# Altium project Powermodule-v11.0.0.PrjPcb (part 1 of 5)
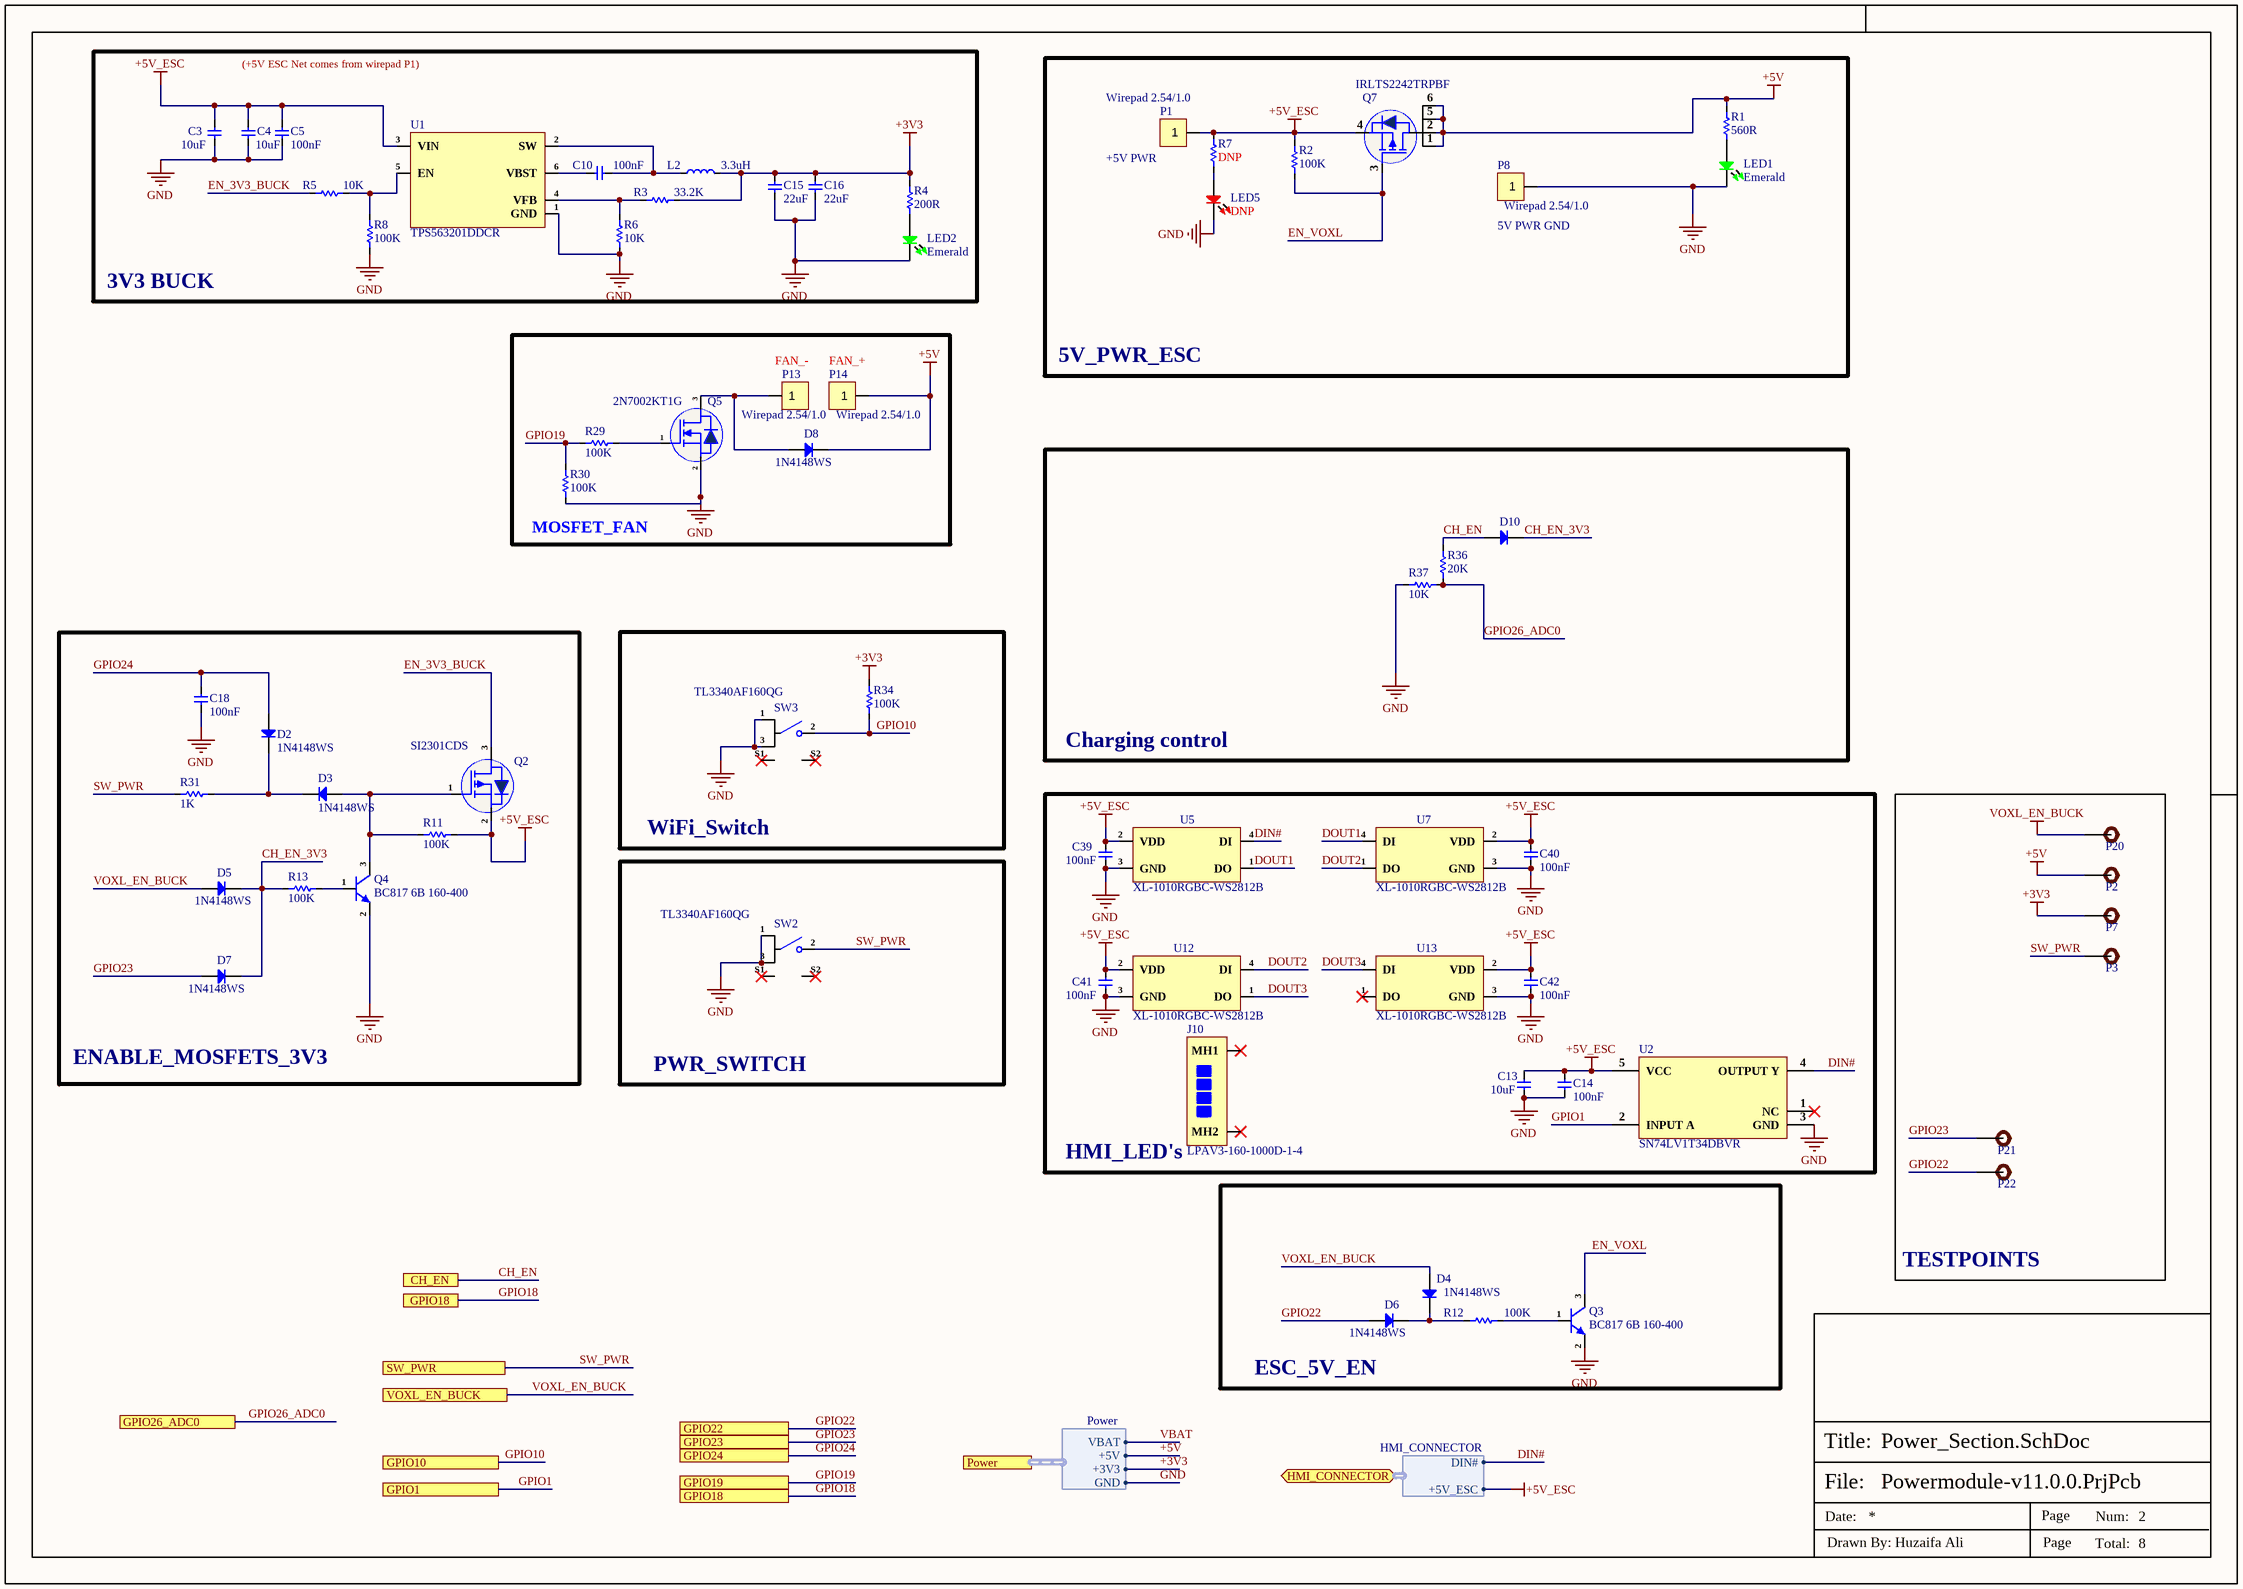
[diagram p0: Power_Section.SchDoc]
7 sheets, 227 parts. Net scope: flat (ports and power ports of the same name join across sheets).
Board file: PCB-Powermodule-v11.0.0.PcbDoc
Sheets:
  Power_Section.SchDoc
  Controller_Section.SchDoc
  FlashMemory_Section.SchDoc
  WiFiModule_Section.SchDoc
  Connector_Section.SchDoc
  USB HUB_Section.SchDoc
  RTC_Section.SchDoc

## Sheet Power_Section.SchDoc
size 420 x 297 mm; SheetNumber: 2; SheetTotal: 8

### Parts
C3  10uF  [Cap-0603]
C4  10uF  [Cap-0603]
C5  100nF  [cap-0402]
C10  100nF  [cap-0402]
C13  10uF  [Cap-0603]
C14  100nF  [cap-0402]
C15  22uF  [Cap-0402]
C16  22uF  [Cap-0402]
C18  100nF  [cap-0402]
C39  100nF  [cap-0402]
C40  100nF  [cap-0402]
C41  100nF  [cap-0402]
C42  100nF  [cap-0402]
D2  1N4148WS  [SOD-323]
D3  1N4148WS  [SOD-323]
D4  1N4148WS  [SOD-323]
D5  1N4148WS  [SOD-323]
D6  1N4148WS  [SOD-323]
D7  1N4148WS  [SOD-323]
D8  1N4148WS  [SOD-323]
D10  1N4148WS  [SOD-323]  (value not drawn)
J10  LPAV3-160-1000D-1-4  [LPAV3-160-1000D-1-4]
L2  3.3uH  [VLS3012HBX-3R3M]
LED1  Emerald  [LED-0603]
LED2  Emerald  [LED-0603]
LED5  DNP  [LED-0603]
P1  Wirepad 2.54/1.0  [Wirepad 2.54/1.0]  (no BOM)
P2  TEST POINT  [Test-point]  (value not drawn)
P3  TEST POINT  [Test-point]  (value not drawn)
P7  TEST POINT  [Test-point]  (value not drawn)
P8  Wirepad 2.54/1.0  [Wirepad 2.54/1.0]  (no BOM)
P13  Wirepad 2.54/1.0  [Wirepad 2.54/1.0]  (no BOM)
P14  Wirepad 2.54/1.0  [Wirepad 2.54/1.0]  (no BOM)
P20  TEST POINT  [Test-point]  (value not drawn)
P21  TEST POINT  [Test-point]  (value not drawn)
P22  TEST POINT  [Test-point]  (value not drawn)
Q2  SI2301CDS  [SOT-23]
Q3  BC817 6B 160-400  [SOT-23]
Q4  BC817 6B 160-400  [SOT-23]
Q5  2N7002KT1G  [SOT-23]
Q7  IRLTS2242TRPBF  [6-TSOP_]
R1  560R  [Res-0402]
R2  100K  [Res-0402]
R3  33.2K  [Res-0603]
R4  200R  [Res-0402]
R5  10K  [Res-0402]
R6  10K  [Res-0402]
R7  DNP  [Res-0402]
R8  100K  [Res-0402]
R11  100K  [Res-0402]
R12  100K  [Res-0402]
R13  100K  [Res-0402]
R29  100K  [Res-0402]
R30  100K  [Res-0402]
R31  1K  [Res-0402]
R34  100K  [Res-0402]
R36  20K  [Res-0603]
R37  10K  [Res-0402]
SW2  TL3340AF160QG  [TL3340AF160QG]
SW3  TL3340AF160QG  [TL3340AF160QG]
U1  TPS563201DDCR  [SOT-23-6 THIN]
U2  SN74LV1T34DBVR  [SOT-23-5]
U5  XL-1010RGBC-WS2812B  [XL-1010RGBC-WS2812B]
U7  XL-1010RGBC-WS2812B  [XL-1010RGBC-WS2812B]
U12  XL-1010RGBC-WS2812B  [XL-1010RGBC-WS2812B]
U13  XL-1010RGBC-WS2812B  [XL-1010RGBC-WS2812B]

### Blocks framed on the sheet
3V3 BUCK: C3-C5 C10 C15 C16 L2 LED2 R3-R6 R8 U1
5V_PWR_ESC: LED1 LED5 P1 P8 Q7 R1 R2 R7
MOSFET_FAN: D8 P13 P14 Q5 R29 R30
Charging control: D10 R36 R37
ENABLE_MOSFETS_3V3: C18 D2 D3 D5 D7 Q2 Q4 R11 R13 R31
WiFi_Switch: R34 SW3
HMI_LED's: C13 C14 C39-C42 J10 U2 U5 U7 U12 U13
TESTPOINTS: P2 P3 P7 P20-P22
PWR_SWITCH: SW2
ESC_5V_EN: D4 D6 Q3 R12

### Ports
CH_EN (see Top-Sheet[2C], Connector_Section[4D]), GPIO1 (see Top-Sheet[2C], Controller_Section[1D]), GPIO10 (see Top-Sheet[2C], Controller_Section[1D]), GPIO18 (see Top-Sheet[2C], Connector_Section[4D], Controller_Section[1D]), GPIO19 (see Top-Sheet[2C], Controller_Section[1D]), GPIO22 (see Top-Sheet[2B], Controller_Section[1D]), GPIO23 (see Top-Sheet[2B], Controller_Section[1D]), GPIO24 (see Top-Sheet[2B], Controller_Section[1D]), GPIO26_ADC0 (see Top-Sheet[2C], Controller_Section[1D]), HMI_CONNECTOR (bidir, harness HMI_CONNECTOR, see Top-Sheet[1B], Connector_Section[4D]), Power (harness Power, see Top-Sheet[1B], Connector_Section[4D], Controller_Section[2D], FlashMemory_Section[1D], RTC_Section[2D], USB HUB_Section[1D], WiFiModule_Section[2D]), SW_PWR (see Top-Sheet[1C], Connector_Section[1D]), VOXL_EN_BUCK (see Top-Sheet[1B], Connector_Section[2D])

### Harnesses
Power: +5V, +3V3, GND, VBAT
HMI_CONNECTOR: DIN#, +5V_ESC

### Nets
+3V3: C15.2 C16.2 L2.2 P7.1 R3.2 R4.2 R34.1 ; port Power.+3V3
+5V: D8.1(K) P2.1 P14.1 Q7.1(D) Q7.2(D) Q7.5(D) Q7.6(D) R1.2 ; port Power.+5V
+5V_ESC: C3.2 C4.2 C5.2 C13.2 C14.2 C39.1 C40.1 C41.1 C42.1 P1.1 Q2.2(S) Q7.4(S) R2.2 R7.2 R11.1 U1.3(VIN) U2.5(VCC) U5.2(VDD) U7.2(VDD) U12.2(VDD) U13.2(VDD) ; port HMI_CONNECTOR.+5V_ESC
GND: C3.1 C4.1 C5.1 C13.1 C14.1 C15.1 C16.1 C18.2 C39.2 C40.2 C41.2 C42.2 LED1.2 LED2.2 LED5.2 P8.1 Q3.2(E) Q4.2(E) Q5.2(S) R6.1 R8.1 R30.1 R37.1 SW2.1(COM_1) SW2.3(COM_2) SW3.1(COM_1) SW3.3(COM_2) U1.1(GND) U2.3(GND) U5.3(GND) U7.3(GND) U12.3(GND) U13.3(GND) ; port Power.GND
VOXL_EN_BUCK: D4.2(A) D5.2(A) P20.1 ; port VOXL_EN_BUCK
CH_EN: D10.2(A) R36.2 ; port CH_EN
CH_EN_3V3: D5.1(K) D7.1(K) D10.1(K) R13.2
DIN#: U2.4(OUTPUT_Y) U5.4(DI) ; port HMI_CONNECTOR.DIN#
DOUT1: U5.1(DO) U7.4(DI)
DOUT2: U7.1(DO) U12.4(DI)
DOUT3: U12.1(DO) U13.4(DI)
EN_3V3_BUCK: Q2.3(D) R5.1
EN_VOXL: Q3.3(C) Q7.3(G) R2.1
GPIO1: U2.2(INPUT_A) ; port GPIO1
GPIO10: R34.2 SW3.2(NO) ; port GPIO10
GPIO19: R29.2 R30.2 ; port GPIO19
GPIO22: D6.2(A) P22.1 ; port GPIO22
GPIO23: D7.2(A) P21.1 ; port GPIO23
GPIO24: C18.1 D2.2(A) ; port GPIO24
GPIO26_ADC0: R36.1 R37.2 ; port GPIO26_ADC0
SW_PWR: P3.1 R31.1 SW2.2(NO) ; port SW_PWR
VBAT: port Power.VBAT
NetC10_1: C10.1 L2.1 U1.2(SW)
NetC10_2: C10.2 U1.6(VBST)
NetD2_1: D2.1(K) D3.1(K) R31.2
NetD3_2: D3.2(A) Q2.1(G) Q4.3(C) R11.2
NetD4_1: D4.1(K) D6.1(K) R12.1
NetD8_2: D8.2(A) P13.1 Q5.3(D)
NetLED1_1: LED1.1 R1.1
NetLED2_1: LED2.1 R4.1
NetLED5_1: LED5.1 R7.1
NetQ3_1: Q3.1(B) R12.2
NetQ4_1: Q4.1(B) R13.1
NetQ5_1: Q5.1(G) R29.1
NetR3_1: R3.1 R6.2 U1.4(VFB)
NetR5_2: R5.2 R8.2 U1.5(EN)

Not connected (* = marked no-connect by the designer): J10 MH1* MH2*; SW2 S1(GND)* S2(GND)*; SW3 S1(GND)* S2(GND)*; U2 1(NC)*; U13 1(DO)*

### Notes on the sheet
- (+5V ESC Net comes from wirepad P1)
- +5V PWR
- (near P8) 5V PWR GND
- (near P13) FAN_-
- (near P14) FAN_+
- File:
- Title:
- Date:
- Page
- Num:
- Total:
- Drawn By: Huzaifa Ali

### Library data of the parts
C3 C4 C13 = GRM188R61E106KA73D: CAP CER 10UF 25V X5R 0603; Manufacturer: Murata; Supplier 1: Mouser; Manufacturer Part Number: GRM188R61E106KA73D; RoHS: Yes; Category: Ceramic Capacitors; Stock 1: 319428; Pricing 1: 1=0.36000, 10=0.25800, 50=0.25800, 100=0.15500, 1000=0.09800, 10000=0.06900 (USD); Case/Package: 0603; RoHS Compliant: Yes; ComponentLink1URL: https://search.murata.co.jp/Ceramy/image/img/A01X/G101/ENG/GRM188R61E106KA73-01.pdf?src-supplier=Digi-Key; ComponentLink1Description: https://search.murata.co.jp/Ceramy/image/img/A01X/G101/ENG/GRM188R61E106KA73-01.pdf?src-supplier=Digi-Key; Supplier Part Number 1: 81-GRM188R61E106KA3D; LCSC Part Number: C344022
C5 C10 C14 C18 C39-C42 = C1005X7R1H104KT000F: CAP CER 0.1UF 50V X7R 0402; Manufacturer: TDK; Tolerance: 10%; Voltage: 25V; Item Type: Capacitor; Supplier 1: Avnet; Manufacturer Part Number: C1005X7R1H104KT000F; RoHS: No; Category: Ceramic Capacitors; Dielectric: X7R; Supplier Part Number 1: C1005X7R1H104KT000F; LCSC Part Number: C361198; ComponentLink1Description: LCSC; ComponentLink1URL: https://www.lcsc.com/product-detail/Multilayer-Ceramic-Capacitors-MLCC-SMD-SMT_TDK-C1005X7R1H104KT000F_C361198.html
C15 C16 = GRM158R61A226ME15D: CAP CER 22UF 10V X5R 0402; Manufacturer: Murata; Material: 4241ConductorMaterial; Dielectric: 1537DielectricType; Tolerance: 20%; Item Type: Capacitor; Supplier: Mouser; Supplier Part Number: 81-GRM158R61A226ME5D; Manufacturer Part Number: GRM158R61A226ME15D; RoHS: Yes; Stock: 328944; Pricing: 1=0.46, 10=0.225, 50=0.225, 100=0.146, 1000=0.124, 10000=0.106 (USD); Case/Package: 343Case; Min Operating Temperature: -55°C; Max Operating Temperature: 85°C; Value: 22uF; Voltage Rating: 10V; Voltage Rating (DC): 10V; Length: 1mm; Width: 500um; Height: 800um; Thickness: 800um; LCSC Part Number: C3845593; Category: Ceramic Capacitors
D2-D8 D10 = 1N4148WS: 75V 200mW Single 1.25V@150mA 4ns 150mA SOD-323 Switching Diode ROHS; Manufacturer: Guangdong Hottech; Manufacturer Part Number: 1N4148WS; Package: SOD-323; LCSC Part Number: C181133; Item Type: Diode
J10 = LPAV3-160-1000D-1-4: LED INDICATION, ROUND, CLEAR, DO; Manufacturer: Bivar; Item Type: Light Pipe; Lens Style: Round,Domed; Lens Size: 3mm; Supplier: Digikey; Supplier Part Number: 492-LPAV3-160-1000D-1-4-ND; Manufacturer Part Number: LPAV3-160-1000D-1-4; RoHS: No; Pricing: 1=3.89, 10=2.865, 100=2.2565, 500=1.98982, 1000=1.90308, 2000=1.82968, 5000=1.74974 (USD); Mounting Technology: Press-Fit,Board; Series: -; ComponentLink1URL: https://cdn2.hubspot.net/hubfs/5642389/LPAV3-160-1000D-1-4_A.pdf?src-supplier=Digikey; ComponentLink1Description: https://cdn2.hubspot.net/hubfs/5642389/LPAV3-160-1000D-1-4_A.pdf?src-supplier=Digikey
L2 = VLS3012HBX-3R3M: FIXED IND 3.3UH 2.63A 150MOHM SM; Manufacturer: TDK; Core Material: Metal; Tolerance: 20%; Saturation Current: 2.82A; Shielding: Shielded; DC Resistance (DCR): 150mR; Test Frequency: 1MHz; Supplier: Digi-Key; Supplier Part Number: 445-175070-1-ND; Manufacturer Part Number: VLS3012HBX-3R3M; RoHS: Yes; Category: Fixed Inductors; Stock: 9595; Pricing: 1=0.6, 10=0.512, 25=0.4692, 50=0.4264, 100=0.3795, 250=0.3582, 500=0.30702, 1000=0.27291 (USD); Mounting Technology: Surface Mount; Case/Package: Nonstandard; Min Operating Temperature: -40°C; Max Operating Temperature: 105°C; Packaging: Cut Tape; Value: 3.3uH; Current Rating: 2.63A; Series: VLS-HBX; RoHS Compliant: Yes; ComponentLink1URL: http://www.farnell.com/datasheets/2724074.pdf?src-supplier=Farnell; ComponentLink1Description: http://www.farnell.com/datasheets/2724074.pdf?src-supplier=Farnell; ComponentLink2URL: https://product.tdk.com/info/en/catalog/datasheets/inductor_commercial_power_vls3012hbx_en.pdf?src-supplier=Digi-Key; ComponentLink2Description: https://product.tdk.com/info/en/catalog/datasheets/inductor_commercial_power_vls3012hbx_en.pdf?src-supplier=Digi-Key; ComponentLink3URL: https://product.tdk.com/info/en/catalog/datasheets/inductor_commercial_power_vls3012hbx_en.pdf?ref_disty=digikey&src-supplier=Digi-Key; ComponentLink3Description: https://product.tdk.com/info/en/catalog/datasheets/inductor_commercial_power_vls3012hbx_en.pdf?ref_disty=digikey&src-supplier=Digi-Key; ComponentLink4URL: http://www.farnell.com/datasheets/2724074.pdf?src-supplier=Newark; ComponentLink4Description: http://www.farnell.com/datasheets/2724074.pdf?src-supplier=Newark
LED1 LED2 = NCD0603G2: Emerald 0603 Light Emitting Diodes (LED) ROHS; Manufacturer: Foshan NationStar Optoelectronics; Manufacturer Part Number: NCD0603G2; Package: 0603; LCSC Part Number: C87326; Item Type: LED; ComponentLink1Description: LCSC; ComponentLink1URL: https://www.lcsc.com/product-detail/Light-Emitting-Diodes-LED_Foshan-NationStar-Optoelectronics-NCD0603G2_C87326.html
LED5 = NCD0603R3: RED LED 0603 Light Emitting Diodes; Manufacturer: Foshan NationStar Optoelectronics; Manufacturer Part Number: NCD0603R3; Package: 0603; Item Type: LED; LCSC Part Number: C3151730; ComponentLink1Description: LCSC; ComponentLink1URL: https://www.lcsc.com/product-detail/Light-Emitting-Diodes-LED_Foshan-NationStar-Optoelectronics-NCD0603R3_C3151730.html
P2 P3 P7 P20-P22 = TEST POINT: Test Point ON; Item Type: TEST POINT; Manufacturer Part Number: TEST POINT
Q2 = SI2301CDS: null 3A 400mW 112mΩ@4.5V,2.8A 1V@250uA P Channel SOT-23 MOSFETs ROHS; Manufacturer: FUXINSEMI; Manufacturer Part Number: SI2301CDS; LCSC Part Number: C5290223; Item Type: SOT-23; ComponentLink1Description: LCSC; ComponentLink1URL: https://www.lcsc.com/product-detail/MOSFETs_FUXINSEMI-SI2301CDS_C5290223.html; Package: MOSFET
Q3 Q4 = BC817 6B 160-400: 45V 300mW 100@100mA,1V 500mA NPN SOT-23 Bipolar Transistors - BJT ROHS; Manufacturer: DOWO; Manufacturer Part Number: BC817 6B 160-400; Package: SOT-23; LCSC Part Number: C371086; Item Type: Transistor; ComponentLink1Description: LCSC; ComponentLink1URL: https://www.lcsc.com/product-detail/Bipolar-Transistors-BJT_DOWO-BC817-6B-160-400_C371086.html
Q5 = 2N7002KT1G: MOSFET N-CH 60V 320MA SOT23-3; Manufacturer: ON Semiconductor; Input Capacitance: 24.5pF; Max Power Dissipation: 420mW; Rds On Max: 1.6R; Rise Time: 9ns; Nominal Vgs: 2.3V; Number of Elements: 1; Power Dissipation: 300mW; Turn-Off Delay Time: 55.8ns; Turn-On Delay Time: 12.2ns; Element Configuration: Single; Gate to Source Voltage (Vgs): 20V; Polarity: N-CHANNEL; Number of Channels: 1NUMBER; Supplier: Future Electronics; Supplier Part Number: 3445699; Manufacturer Part Number: 2N7002KT1G; RoHS: Yes; Category: MOSFETs; Stock: 51000; Pricing: 3000=0.0238, 12000=0.0228, 45000=0.0218, 75000=0.0215, 150000=0.0204 (USD); Case/Package: SOT-23-3; Pins: 3; Contact Plating: Tin,Matte; Min Operating Temperature: -55°C; Max Operating Temperature: 150°C; Packaging: Tape and Reel; Continuous Drain Current (ID): 320mA; Package Quantity: 1; Drain to Source Breakdown Voltage: 60V; Fall Time: 9ns; Drain to Source Resistance: 1.6R; Threshold Voltage: 2.3V; Series: -; Drain-source On Resistance-Max: 1.6R; Length: 3.04mm; Width: 1.4mm; Height: 1.01mm; Radiation Hardening: No; Reach SVHC Compliant: No; Lead Free: Lead Free; Halogen Free: Halogen Free; RoHS Compliant: Yes; ComponentLink1URL: https://datasheet.ciiva.com/1254/2n7002k-d-1254499.pdf?src-supplier=Newark; ComponentLink1Description: https://datasheet.ciiva.com/1254/2n7002k-d-1254499.pdf?src-supplier=Newark; ComponentLink2URL: https://datasheet.ciiva.com/16220/2n7002k-d-16220919.pdf?src-supplier=Future+Electronics; ComponentLink2Description: https://datasheet.ciiva.com/16220/2n7002k-d-16220919.pdf?src-supplier=Future+Electronics; ComponentLink3URL: https://datasheet.ciiva.com/936/2n7002k-d-936793.pdf?src-supplier=Digikey; ComponentLink3Description: https://datasheet.ciiva.com/936/2n7002k-d-936793.pdf?src-supplier=Digikey; LCSC Part Number: C116584; Item Type: MOSFET
Q7 = IRLTS2242TRPBF: MOSFET P-CH 20V 6.9A 6TSOP; Manufacturer: Infineon; Item Type: MOSFETs; Turn-Off Delay Time: 18ns; Turn-On Delay Time: 5.8ns; Drain to Source Breakdown Voltage: -20V; Drain to Source Resistance: 26mR; Element Configuration: 5460ElementConfiguration; Fall Time: 68ns; Number of Channels: 1NUMBER; On-State Resistance: -32mR; Power Dissipation: 2W; Value: 55MR; Supplier: Mouser; LCSC Part Number: C538190; Manufacturer Part Number: IRLTS2242TRPBF; RoHS: Yes; Stock: 67736; Pricing: 1=0.44, 10=0.372, 50=0.372, 100=0.259, 1000=0.164, 10000=0.129 (USD); Number of Elements: 1NUMBER; Package Quantity: 3000NUMBER; Length: 3mm; Width: 1.75mm; Height: 1.3mm; Radiation Hardening: 5898YesNo; ComponentLink1URL: http://www.farnell.com/datasheets/1911990.pdf?src-supplier=Farnell; ComponentLink1Description: http://www.farnell.com/datasheets/1911990.pdf?src-supplier=Farnell; ComponentLink2URL: http://www.farnell.com/datasheets/1911990.pdf?src-supplier=Element14; ComponentLink2Description: http://www.farnell.com/datasheets/1911990.pdf?src-supplier=Element14; ComponentLink3URL: https://datasheet.octopart.com/IRLTS2242TRPBF-Infineon-datasheet-41193307.pdf?src-supplier=Newark; ComponentLink3Description: https://datasheet.octopart.com/IRLTS2242TRPBF-Infineon-datasheet-41193307.pdf?src-supplier=Newark; ComponentLink4URL: https://www.infineon.com/dgdl/irlts2242pbf.pdf?fileId=5546d462533600a401535671e9a12718&src-supplier=Digikey; ComponentLink4Description: https://www.infineon.com/dgdl/irlts2242pbf.pdf?fileId=5546d462533600a401535671e9a12718&src-supplier=Digikey; ComponentLink5URL: https://datasheet.octopart.com/IRLTS2242TRPBF-Infineon-datasheet-11534477.pdf?src-supplier=Farnell; ComponentLink5Description: https://datasheet.octopart.com/IRLTS2242TRPBF-Infineon-datasheet-11534477.pdf?src-supplier=Farnell
R1 = RC0402FR-07560RL: RES 560 OHM 1% 1/16W 0402; Manufacturer: Yageo; Power Rating: 63mW; Temperature Coefficient: 100ppm/°C; Voltage Rating: 50V; Item Type: Resistor; Supplier: Future Electronics; Supplier Part Number: 8872046; Manufacturer Part Number: RC0402FR-07560RL; RoHS: Yes; Category: Chip SMD Resistors; Stock: 1360000; Pricing: 10000=0.0012, 100000=0.0011, 300000=0.0011, 1250000=0.001, 3000000=0.0009 (USD); Case/Package: 0402; Case Code (Metric): 1005; Case Code (Imperial): 0402; Min Operating Temperature: -55°C; Max Operating Temperature: 155°C; Tolerance: 1%; Packaging: Tape and Reel; Value: 560R; Package Quantity: 1; Resistor Type: Thick Film; Number of Terminations: 2; Termination: SMD/SMT; Max Power Dissipation: 63mW; Features: Moisture Resistant; Series: RC; Construction: Rectangular; Resistance Tolerance: 1%; Length: 1mm; Width: 0.02inch; Height: 0.016inch; Depth: 0.5mm; RoHS Compliant: Yes; Military Standard: Not; Lead Free: Lead Free; Reach SVHC Compliant: Unknown; ComponentLink1URL: https://datasheet.ciiva.com/2453/pyu-r-int-thick-7-2453458.pdf?src-supplier=Digikey; ComponentLink1Description: https://datasheet.ciiva.com/2453/pyu-r-int-thick-7-2453458.pdf?src-supplier=Digikey; ComponentLink2URL: https://datasheet.ciiva.com/2453/pyu-r-int-thick-7-2453459.pdf?src-supplier=Digikey; ComponentLink2Description: https://datasheet.ciiva.com/2453/pyu-r-int-thick-7-2453459.pdf?src-supplier=Digikey; ComponentLink3URL: https://datasheet.ciiva.com/2453/pyu-r-int-thick-7-2453457.pdf?src-supplier=Digikey; ComponentLink3Description: https://datasheet.ciiva.com/2453/pyu-r-int-thick-7-2453457.pdf?src-supplier=Digikey; ComponentLink4URL: https://datasheet.ciiva.com/12558/pyu-rc0402-51-rohs-l-6-r-8721-12558383.pdf?src-supplier=Mouser; ComponentLink4Description: https://datasheet.ciiva.com/12558/pyu-rc0402-51-rohs-l-6-r-8721-12558383.pdf?src-supplier=Mouser; ComponentLink5URL: https://datasheet.ciiva.com/7850/1018594-7850042.pdf?src-supplier=Element14; ComponentLink5Description: https://datasheet.ciiva.com/7850/1018594-7850042.pdf?src-supplier=Element14; ComponentLink6URL: https://datasheet.ciiva.com/7850/1018594-7850043.pdf?src-supplier=Element14; ComponentLink6Description: https://datasheet.ciiva.com/7850/1018594-7850043.pdf?src-supplier=Element14; LCSC Part Number: C163460
R2 R8 R11-R13 R29 R30 R34 = RC0402FR-07100KL: RES 100K OHM 1% 1/16W 0402; Manufacturer: Yageo; Resistance: 100kR; Temperature Coefficient: 100ppm/°C; Power Rating: 63mW; Voltage Rating: 50V; Item Type: Resistor; Supplier 1: Mouser; Manufacturer Part Number: RC0402FR-07100KL; RoHS: Yes; Category: Chip SMD Resistors; Stock 1: 7759549; Pricing 1: 1=0.10000, 10=0.01200, 50=0.01200, 100=0.00500, 1000=0.00300, 2500=0.00200, 10000=0.00100 (USD); Case/Package: 0402; Case Code (Metric): 1005; Case Code (Imperial): 0402; Min Operating Temperature: -55°C; Max Operating Temperature: 155°C; Resistor Type: Thick Film; Tolerance: 1%; Packaging: Tape and Reel; Package Quantity: 1; Number of Terminations: 2; Termination: SMD/SMT; Max Power Dissipation: 63mW; Working Voltage: 50V; Features: Moisture Resistant; Series: RC; Resistance Tolerance: 1%; Construction: Rectangular; Technology: THICK FILM; Length: 0.039inch; Width: 0.02inch; Height: 0.016inch; Depth: 0.5mm; REACH SVHC: No SVHC; Lead Free: Lead Free; RoHS Compliant: Yes; Military Standard: Not; ComponentLink1URL: https://datasheet.ciiva.com/11819/0900766b80c66297-11819452.pdf?src-supplier=RSComponents; ComponentLink1Description: https://datasheet.ciiva.com/11819/0900766b80c66297-11819452.pdf?src-supplier=RSComponents; ComponentLink2URL: https://datasheet.ciiva.com/22747/1018594-22747509.pdf?src-supplier=Element14; ComponentLink2Description: https://datasheet.ciiva.com/22747/1018594-22747509.pdf?src-supplier=Element14; ComponentLink3URL: https://datasheet.ciiva.com/2453/pyu-r-int-thick-7-2453362.pdf?src-supplier=Digi-Key; ComponentLink3Description: https://datasheet.ciiva.com/2453/pyu-r-int-thick-7-2453362.pdf?src-supplier=Digi-Key; ComponentLink4URL: https://datasheet.ciiva.com/2453/pyu-r-int-thick-7-2453363.pdf?src-supplier=Digi-Key; ComponentLink4Description: https://datasheet.ciiva.com/2453/pyu-r-int-thick-7-2453363.pdf?src-supplier=Digi-Key; ComponentLink5URL: https://datasheet.ciiva.com/2453/pyu-r-int-thick-7-2453361.pdf?src-supplier=Digi-Key; ComponentLink5Description: https://datasheet.ciiva.com/2453/pyu-r-int-thick-7-2453361.pdf?src-supplier=Digi-Key; ComponentLink6URL: https://datasheet.ciiva.com/12667/pyu-rc0402-51-rohs-l-6-r-12667930.pdf?src-supplier=Mouser; ComponentLink6Description: https://datasheet.ciiva.com/12667/pyu-rc0402-51-rohs-l-6-r-12667930.pdf?src-supplier=Mouser; ComponentLink7URL: https://datasheet.ciiva.com/15189/getdatasheetpartid-323696-15189334.pdf?src-supplier=Verical; ComponentLink7Description: https://datasheet.ciiva.com/15189/getdatasheetpartid-323696-15189334.pdf?src-supplier=Verical; Supplier Part Number 1: 603-RC0402FR-07100KL; LCSC Part Number: C60491
R3 = RC0603FR-0733K2L: RES 33.2K OHM 1% 1/10W 0603; Manufacturer: Yageo; Resistance: 33.2kR; Power Rating: 100mW; Voltage Rating: 50V; Temperature Coefficient: 100ppm/°C; Supplier 1: Digi-Key; Manufacturer Part Number: RC0603FR-0733K2L; RoHS: Yes; Category: Chip SMD Resistors; Stock 1: 1293262; Pricing 1: 1=0.10000, 10=0.02300, 100=0.00930, 1000=0.00417, 2500=0.00362 (USD); Mount: Surface Mount; Case/Package: 0603; Case Code (Imperial): 0603; Case Code (Metric): 1608; Size Code: 0603; Min Operating Temperature: -55°C; Max Operating Temperature: 155°C; Tolerance: 1%; Packaging: Tape and Reel; Termination: SMD/SMT; Resistor Type: Thick Film; Voltage Rating (DC): 50V; Features: Moisture Resistant; Series: RC; Max Power Dissipation: 100mW; Number of Terminations: 2; Construction: Rectangular; Technology: THICK FILM; Length: 1.6mm; Height: 0.45mm; Depth: 0.8mm; Military Standard: Not; Lead Free: Lead Free; RoHS Compliant: Yes; ComponentLink1URL: https://datasheet.ciiva.com/11808/0900766b80f96399-11808316.pdf?src-supplier=RSComponents; ComponentLink1Description: https://datasheet.ciiva.com/11808/0900766b80f96399-11808316.pdf?src-supplier=RSComponents; Supplier Part Number 1: 311-33.2KHRCT-ND; LCSC Part Number: C185338
R4 = RC0402FR-07200RL: RES 200 OHM 1% 1/16W 0402; Manufacturer: Yageo; Temperature Coefficient: 100ppm/°C; Power Rating: 63mW; Voltage Rating (DC): 50V; Supplier 1: Digi-Key; Manufacturer Part Number: RC0402FR-07200RL; RoHS: Yes; Category: Chip SMD Resistors; Stock 1: 19778; Pricing 1: 1=0.10000, 10=0.01600, 100=0.00660, 1000=0.00299, 2500=0.00259, 5000=0.00214 (USD); Case/Package: 0402; Case Code (Metric): 1005; Case Code (Imperial): 0402; Size Code: 0402; Min Operating Temperature: -55°C; Max Operating Temperature: 155°C; Tolerance: 1%; Resistance: 200R; Resistor Type: Thick Film; Packaging: Tape and Reel; Voltage Rating: 50V; Package Quantity: 1; Number of Terminations: 2; Termination: SMD/SMT; Max Power Dissipation: 63mW; Features: Moisture Resistant; Series: RC; Construction: Rectangular; Resistance Tolerance: 1%; Length: 1mm; Width: 0.02inch; Height: 0.016inch; Depth: 0.5mm; REACH SVHC: No SVHC; Lead Free: Lead Free; RoHS Compliant: Yes; Military Standard: Not; ComponentLink1URL: https://datasheet.ciiva.com/2553/pyu-r-int-thick-7-2553232.pdf?src-supplier=Digi-Key; ComponentLink1Description: https://datasheet.ciiva.com/2553/pyu-r-int-thick-7-2553232.pdf?src-supplier=Digi-Key; ComponentLink2URL: https://datasheet.ciiva.com/7983/1018594-7983509.pdf?src-supplier=Element14; ComponentLink2Description: https://datasheet.ciiva.com/7983/1018594-7983509.pdf?src-supplier=Element14; ComponentLink3URL: https://datasheet.ciiva.com/16804/pyu-rc0402-51-rohs-l-6-r-16804406.pdf?src-supplier=Future+Electronics; ComponentLink3Description: https://datasheet.ciiva.com/16804/pyu-rc0402-51-rohs-l-6-r-16804406.pdf?src-supplier=Future+Electronics; ComponentLink4URL: https://datasheet.ciiva.com/15189/getdatasheetpartid-331152-15189383.pdf?src-supplier=Verical; ComponentLink4Description: https://datasheet.ciiva.com/15189/getdatasheetpartid-331152-15189383.pdf?src-supplier=Verical; ComponentLink5URL: https://datasheet.ciiva.com/7849/1018594-7849898.pdf?src-supplier=Element14; ComponentLink5Description: https://datasheet.ciiva.com/7849/1018594-7849898.pdf?src-supplier=Element14; ComponentLink6URL: https://datasheet.ciiva.com/5562/pyu-rc0402-51-rohs-l-6-r-8721-5562539.pdf?src-supplier=Mouser; ComponentLink6Description: https://datasheet.ciiva.com/5562/pyu-rc0402-51-rohs-l-6-r-8721-5562539.pdf?src-supplier=Mouser; ComponentLink7URL: https://datasheet.ciiva.com/7849/1018594-7849899.pdf?src-supplier=Element14; ComponentLink7Description: https://datasheet.ciiva.com/7849/1018594-7849899.pdf?src-supplier=Element14; ComponentLink8URL: https://datasheet.ciiva.com/2553/pyu-r-int-thick-7-2553230.pdf?src-supplier=Digi-Key; ComponentLink8Description: https://datasheet.ciiva.com/2553/pyu-r-int-thick-7-2553230.pdf?src-supplier=Digi-Key; ComponentLink9URL: https://datasheet.ciiva.com/2553/pyu-r-int-thick-7-2553231.pdf?src-supplier=Digi-Key; ComponentLink9Description: https://datasheet.ciiva.com/2553/pyu-r-int-thick-7-2553231.pdf?src-supplier=Digi-Key; Supplier Part Number 1: 311-200LRCT-ND; LCSC Part Number: C114764
R5 R6 R37 = RC0402FR-0710KL: RES 10K OHM 1% 1/16W 0402; Manufacturer: Yageo; Resistance: 10kR; Voltage Rating (DC): 50V; Temperature Coefficient: 100ppm/°C; Power Rating: 62.5mW; Max Power Dissipation: 63mW; Item Type: Resistor; Supplier 1: Mouser; Manufacturer Part Number: RC0402FR-0710KL; RoHS: Yes; Category: Chip SMD Resistors; Stock 1: 18648329; Pricing 1: 1=0.10000, 10=0.01400, 50=0.01400, 100=0.00500, 1000=0.00300, 10000=0.00200 (USD); Case/Package: 0402; Number of Pins: 2; Case Code (Imperial): 0402; Case Code (Metric): 1005; Min Operating Temperature: -55°C; Max Operating Temperature: 155°C; Resistor Type: Thick Film; Tolerance: 1%; Packaging: Tape and Reel; Voltage Rating: 50V; Termination: SMD/SMT; Working Voltage: 50V; Number of Terminations: 2; Features: Moisture Resistant; Series: RC; Resistance Tolerance: 1%; Construction: Rectangular; Length: 1mm; Width: 0.5mm; Height: 0.32mm; Depth: 0.5mm; Lead Pitch: 0.2mm; REACH SVHC: No SVHC; Lead Free: Lead Free; RoHS Compliant: Yes; Military Standard: Not; ComponentLink1URL: https://datasheet.ciiva.com/7660/38568-7660787.pdf?src-supplier=Element14; ComponentLink1Description: https://datasheet.ciiva.com/7660/38568-7660787.pdf?src-supplier=Element14; ComponentLink2URL: https://datasheet.ciiva.com/7849/1686128-7849814.pdf?src-supplier=Element14; ComponentLink2Description: https://datasheet.ciiva.com/7849/1686128-7849814.pdf?src-supplier=Element14; ComponentLink3URL: https://datasheet.ciiva.com/7983/1018594-7983486.pdf?src-supplier=Element14; ComponentLink3Description: https://datasheet.ciiva.com/7983/1018594-7983486.pdf?src-supplier=Element14; ComponentLink4URL: https://datasheet.ciiva.com/22747/1018594-22747512.pdf?src-supplier=Element14; ComponentLink4Description: https://datasheet.ciiva.com/22747/1018594-22747512.pdf?src-supplier=Element14; ComponentLink5URL: https://datasheet.ciiva.com/12667/pyu-rc0402-51-rohs-l-6-r-12667067.pdf?src-supplier=Mouser; ComponentLink5Description: https://datasheet.ciiva.com/12667/pyu-rc0402-51-rohs-l-6-r-12667067.pdf?src-supplier=Mouser; ComponentLink6URL: https://datasheet.ciiva.com/7849/1784430-7849813.pdf?src-supplier=Element14; ComponentLink6Description: https://datasheet.ciiva.com/7849/1784430-7849813.pdf?src-supplier=Element14; ComponentLink7URL: https://datasheet.ciiva.com/7849/1784430-7849815.pdf?src-supplier=Element14; ComponentLink7Description: https://datasheet.ciiva.com/7849/1784430-7849815.pdf?src-supplier=Element14; Supplier Part Number 1: 603-RC0402FR-0710KL; LCSC Part Number: C60490
R7 = RT0402BRD07390RL: RES SMD 390 OHM 0.1% 1/16W 0402; Manufacturer: Yageo; Item Type: Resistors; Value: 390R; Power Rating: 62.5mW; Voltage Rating: 50V; Temperature Coefficient: 25ppm/°C; Max Power Dissipation: 63mW; Supplier: Mouser; LCSC Part Number: C852752; Manufacturer Part Number: RT0402BRD07390RL; RoHS: Yes; Stock: 20717; Pricing: 1=0.12, 10=0.064, 50=0.064, 100=0.049, 1000=0.037, 10000=0.031 (USD); Case/Package: 0402; Case Code (Imperial): 0402; Case Code (Metric): 1005; Weight: 2.3E-05oz; Min Operating Temperature: -55°C; Max Operating Temperature: 155°C; Tolerance: 0.1%; Packaging: Tape and Reel; Termination: SMD/SMT; Number of Terminations: 2; Voltage Rating (DC): 50V; Series: RT; Length: 1mm; Width: 0.5mm; Height: 0.3mm; Lead Free: Lead Free; RoHS Compliant: Yes; ComponentLink1URL: https://datasheet.ciiva.com/12798/pyu-rt-1-to-0-05-rohs-l-4-12798633.pdf?src-supplier=Mouser; ComponentLink1Description: https://datasheet.ciiva.com/12798/pyu-rt-1-to-0-05-rohs-l-4-12798633.pdf?src-supplier=Mouser
R31 = CRCW04021K00FKEDHP: RES SMD 1K OHM 1% 1/5W 0402; Manufacturer: Vishay Dale; Resistance: 1kR; Temperature Coefficient: 100ppm/°C; Power Rating: 125mW; Voltage Rating: 50V; Supplier 1: Digi-Key; Manufacturer Part Number: CRCW04021K00FKEDHP; Stock 1: 315989; Pricing 1: 1=0.15, 10=0.132, 100=0.0506, 1000=0.02226, 2500=0.01923, 5000=0.0172 (USD); Mount: Surface Mount; Case/Package: 0402; Number of Pins: 2; Contact Plating: Tin; Weight: 2.3E-05oz; Case Code (Imperial): 0402; Case Code (Metric): 1005; Size Code: 0402; Min Operating Temperature: -55°C; Max Operating Temperature: 155°C; Tolerance: 1%; Resistor Type: Thick Film; Package Quantity: 10; Packaging: Tape and Reel; Number of Terminations: 2; Termination: SMD/SMT; Max Power Dissipation: 125mW; Voltage Rating (DC): 50V; Features: Automotive AEC-Q200; Series: CRCW-HP; Construction: Rectangular; Technology: THICK FILM; Resistance Tolerance: 1%; Length: 1mm; Width: 0.5mm; Height: 0.3mm; Depth: 0.5mm; Radiation Hardening: No; REACH SVHC: Unknown; Military Standard: Not; Lead Free: Lead Free; RoHS Compliant: Yes; ComponentLink1URL: http://www.farnell.com/datasheets/2339608.pdf?src-supplier=Element14; ComponentLink1Description: http://www.farnell.com/datasheets/2339608.pdf?src-supplier=Element14; ComponentLink2URL: http://www.vishay.com/docs/20043/crcwhpe3.pdf?src-supplier=Digi-Key; ComponentLink2Description: http://www.vishay.com/docs/20043/crcwhpe3.pdf?src-supplier=Digi-Key; ComponentLink3URL: http://www.mouser.com/ds/2/427/crcwhpe3-46056.pdf?src-supplier=Mouser; ComponentLink3Description: http://www.mouser.com/ds/2/427/crcwhpe3-46056.pdf?src-supplier=Mouser; ComponentLink4URL: http://www.vishay.com/docs/20043/crcwhpe3.pdf?src-supplier=Avnet; ComponentLink4Description: http://www.vishay.com/docs/20043/crcwhpe3.pdf?src-supplier=Avnet; ComponentLink5URL: http://www.vishay.com/docs/20043/crcwhpe3.pdf?src-supplier=Future+Electronics; ComponentLink5Description: http://www.vishay.com/docs/20043/crcwhpe3.pdf?src-supplier=Future+Electronics; Supplier Part Number 1: 541-1.00KYCT-ND; LCSC Part Number: C313354
R36 = RC0603FR-0720KL: RES 20K OHM 1% 1/10W 0603; Manufacturer: Yageo; Resistance: 20kR; Temperature Coefficient: 100ppm/°C; Voltage Rating (DC): 50V; Power Rating: 100mW; Item Type: Resistor; Supplier 1: Arrow Electronics; Manufacturer Part Number: RC0603FR-0720KL; RoHS: Yes; Category: Chip SMD Resistors; Stock 1: 945000; Pricing 1: 5000=0.00240, 10000=0.00220, 25000=0.00200, 50000=0.00190, 125000=0.00180 (USD); Case/Package: 0603; Number of Pins: 2; Case Code (Imperial): 0603; Case Code (Metric): 1608; Size Code: 0603; Min Operating Temperature: -55°C; Max Operating Temperature: 155°C; Tolerance: 1%; Packaging: Tape and Reel; Resistor Type: Thick Film; Voltage Rating: 50V; Package Quantity: 1; Termination: SMD/SMT; Number of Terminations: 2; Max Power Dissipation: 100mW; Features: Moisture Resistant; Series: RC; Technology: THICK FILM; Construction: Rectangular; Resistance Tolerance: 1%; Length: 0.063inch; Width: 0.031inch; Height: 0.022inch; Depth: 0.8mm; Lead Free: Lead Free; RoHS Compliant: Yes; REACH SVHC: No SVHC; Military Standard: Not; ComponentLink1URL: https://datasheet.ciiva.com/11808/0900766b80f96399-11808275.pdf?src-supplier=RSComponents; ComponentLink1Description: https://datasheet.ciiva.com/11808/0900766b80f96399-11808275.pdf?src-supplier=RSComponents; ComponentLink2URL: https://datasheet.ciiva.com/22747/443971-22747525.pdf?src-supplier=Element14; ComponentLink2Description: https://datasheet.ciiva.com/22747/443971-22747525.pdf?src-supplier=Element14; ComponentLink3URL: https://datasheet.ciiva.com/2453/pyu-r-int-thick-7-2453911.pdf?src-supplier=Digi-Key; ComponentLink3Description: https://datasheet.ciiva.com/2453/pyu-r-int-thick-7-2453911.pdf?src-supplier=Digi-Key; ComponentLink4URL: https://datasheet.ciiva.com/2453/pyu-r-int-thick-7-2453912.pdf?src-supplier=Digi-Key; ComponentLink4Description: https://datasheet.ciiva.com/2453/pyu-r-int-thick-7-2453912.pdf?src-supplier=Digi-Key; ComponentLink5URL: https://datasheet.ciiva.com/2453/pyu-r-int-thick-7-2453910.pdf?src-supplier=Digi-Key; ComponentLink5Description: https://datasheet.ciiva.com/2453/pyu-r-int-thick-7-2453910.pdf?src-supplier=Digi-Key; Supplier Part Number 1: RC0603FR-0720KL; LCSC Part Number: C105575
SW2 SW3 = TL3340AF160QG: Switch Tactile N.O. SPST Round Button Gull Wing 0.05A 12VDC 100000Cycles 1.57N SMD; Manufacturer: E-Switch; Actuator Material: Polyphthalamide; Number of Positions: 2NUMBER; Contact Current Rating: 50mA; Operating Force: 160gf; Voltage Rating (DC): 12V; Contact Resistance: 500mR; Illumination Type: Non-Illuminated,Illuminated; Switch Travel: 0.2mm; Switch Function: Off-Mom; Actuator Type: Standard; Actuator Length: 0.85mm; Supplier: Future Electronics; Supplier Part Number: 9232661; Manufacturer Part Number: TL3340AF160QG; RoHS: Yes; Category: Tactile Switches; Stock: 16000; Pricing: 2000=0.27 (USD); Mounting Technology: Surface Mount; Case/Package: SMD/SMT; Contact Material: Stainless Steel,Silver; Contact Plating: Stainless Steel,Silver; Color: White; Mechanical Life: 100000Cycles; Housing Material: Polyphthalamide; Min Operating Temperature: -35°C; Max Operating Temperature: 85°C; Throw Configuration: SPST; Package Quantity: 1; Packaging: Tape and Reel; Current Rating: 50mA; Max Voltage Rating (DC): 12V; Termination: Gull Wing; Electrical Life: 100000Cycles; Orientation: Right Angle; Series: TL3340; Height: 3.55mm; Size: 3.3mm; Reach SVHC Compliant: No; Lead Free: 5697LeadFree; RoHS Compliant: Yes; ComponentLink1URL: https://datasheet.ciiva.com/7637/tl3340-7637667.pdf?src-supplier=Element14; ComponentLink1Description: https://datasheet.ciiva.com/7637/tl3340-7637667.pdf?src-supplier=Element14; ComponentLink2URL: https://datasheet.ciiva.com/5284/tl3340-28153-5284108.pdf?src-supplier=Mouser; ComponentLink2Description: https://datasheet.ciiva.com/5284/tl3340-28153-5284108.pdf?src-supplier=Mouser; ComponentLink3URL: https://datasheet.ciiva.com/2900/p021301b-2900825.pdf?src-supplier=Digikey; ComponentLink3Description: https://datasheet.ciiva.com/2900/p021301b-2900825.pdf?src-supplier=Digikey; ComponentLink4URL: https://datasheet.ciiva.com/2900/p021301b-2900826.pdf?src-supplier=Digikey; ComponentLink4Description: https://datasheet.ciiva.com/2900/p021301b-2900826.pdf?src-supplier=Digikey; ComponentLink5URL: https://datasheet.ciiva.com/2900/p021301b-2900827.pdf?src-supplier=Digikey; ComponentLink5Description: https://datasheet.ciiva.com/2900/p021301b-2900827.pdf?src-supplier=Digikey
U1 = TPS563201DDCR: IC REG BUCK ADJ 3A TSOT23-6; Manufacturer: Texas Instruments; Number of Outputs: 1; Min Input Voltage: 4.5V; Max Input Voltage: 17V; Min Output Voltage: 768mV; Max Output Voltage: 7V; Switching Frequency: 580kHz; Synchronous Rectifier: Yes; Quiescent Current: 400uA; Output Type: Adjustable; Output Configuration: Positive; Supplier 1: Digi-Key; Manufacturer Part Number: TPS563201DDCR; Stock 1: 0; Pricing 1: 1=0.92, 10=0.812, 25=0.7628, 100=0.5781, 250=0.492, 500=0.4674, 1000=0.3567 (USD); Mount: Surface Mount; Case/Package: SOT-23-6; Number of Pins: 6; Min Operating Temperature: -40°C; Max Operating Temperature: 125°C; Packaging: Tape and Reel; Output Current: 3A; Lead Free: Lead Free; ComponentLink1URL: http://www.ti.com/lit/ds/symlink/tps563201.pdf?src-supplier=Digi-Key; ComponentLink1Description: http://www.ti.com/lit/ds/symlink/tps563201.pdf?src-supplier=Digi-Key; ComponentLink2URL: http://www.ti.com/general/docs/suppproductinfo.tsp?distId=10&amp;gotoUrl=http%3A%2F%2Fwww.ti.com%2Flit%2Fgpn%2Ftps563201&src-supplier=Digi-Key; ComponentLink2Description: http://www.ti.com/general/docs/suppproductinfo.tsp?distId=10&amp;gotoUrl=http%3A%2F%2Fwww.ti.com%2Flit%2Fgpn%2Ftps563201&src-supplier=Digi-Key; ComponentLink3URL: http://www.ti.com/lit/gpn/tps563201?src-supplier=Mouser; ComponentLink3Description: http://www.ti.com/lit/gpn/tps563201?src-supplier=Mouser; Supplier Part Number 1: 296-47238-6-ND; LCSC Part Number: C116592; Item Type: IC
U2 = SN74LV1T34DBVR: IC BUF NON-INVERT 5.5V SOT23-5; Manufacturer: Texas Instruments; Number of Elements: 1; Logic Function: Buffer,Inverting; High Level Output Current: -8mA; Low Level Output Current: 8mA; Min Supply Voltage: 1.6V; Polarity: Non-Inverting; Propagation Delay: 15.5ns; Quiescent Current: 1uA; Supplier 1: Digi-Key; Manufacturer Part Number: SN74LV1T34DBVR; Stock 1: 37360; Pricing 1: 1=0.43, 10=0.349, 25=0.3192, 100=0.2374, 250=0.2152, 500=0.17808, 1000=0.13356 (USD); Mount: Surface Mount; Case/Package: SOT-23-5; Number of Pins: 5; Weight: 0.000353oz; Min Operating Temperature: -40°C; Max Operating Temperature: 125°C; Packaging: Tape and Reel; Number of Bits per Element: 1; Number of Bits: 1; Package Quantity: 3000; Max Supply Voltage: 5.5V; Number of Input Lines: 1; Number of Output Lines: 1; Operating Supply Current: 8mA; Number of Channels: 1; Number of Inputs: 1; Number of Outputs: 1; Radiation Hardening: No; RoHS Compliant: Yes; REACH SVHC: No SVHC; Lead Free: Lead Free; ComponentLink1URL: http://www.ti.com/lit/pdf/sdyu001?src-supplier=Digi-Key; ComponentLink1Description: http://www.ti.com/lit/pdf/sdyu001?src-supplier=Digi-Key; ComponentLink2URL: http://www.ti.com/lit/ds/symlink/sn74lv1t34.pdf?src-supplier=Avnet; ComponentLink2Description: http://www.ti.com/lit/ds/symlink/sn74lv1t34.pdf?src-supplier=Avnet; Supplier Part Number 1: 296-37176-6-ND; LCSC Part Number: C100024; Item Type: IC
U5 U7 U12 U13 = XL-1010RGBC-WS2812B: Colorless transparence -40℃~+150℃ 正贴 RGB 120° 1010 Light Emitting Diodes (LED) ROHS; Manufacturer: XINGLIGHT; Item Type: RGB LED; LCSC Part Number: C5349953; Manufacturer Part Number: XL-1010RGBC-WS2812B; Package: 1010; ComponentLink1Description: LCSC; ComponentLink1URL: https://www.lcsc.com/product-detail/span-style-background-color-ff0-RGB-span-LEDs-Built-in-IC_XINGLIGHT-XL-1010RGBC-WS2812B_C5349953.html